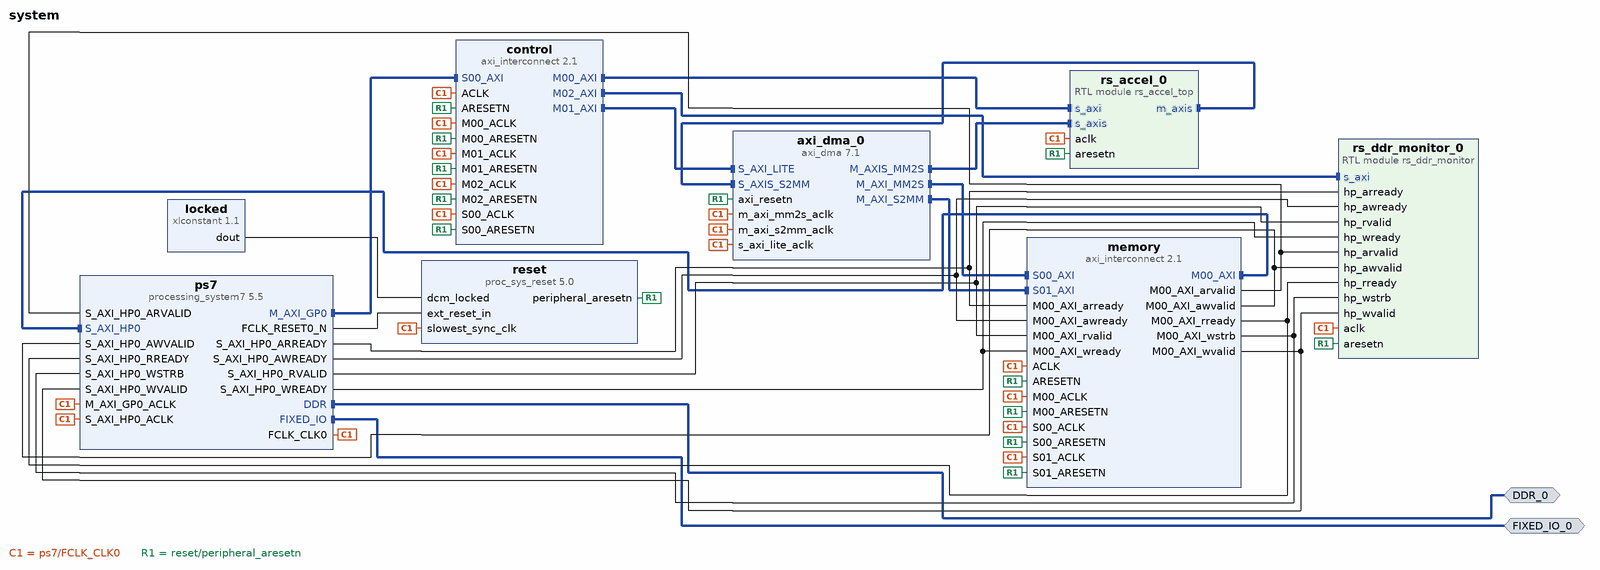
[diagram p0: block diagram of the top level]
# Vivado block design system, xc7z020clg400-1, Vivado 2025.2
create_bd_design system

create_bd_intf_port -mode Master -vlnv xilinx.com:interface:ddrx_rtl:1.0 DDR_0
create_bd_intf_port -mode Master -vlnv xilinx.com:display_processing_system7:fixedio_rtl:1.0 FIXED_IO_0

create_bd_cell -type ip -vlnv xilinx.com:ip:processing_system7:5.5 ps7
set_property -dict [list \
  CONFIG.PCW_APU_PERIPHERAL_FREQMHZ 650 \
  CONFIG.PCW_CRYSTAL_PERIPHERAL_FREQMHZ 50 \
  CONFIG.PCW_ENET0_ENET0_IO {MIO 16 .. 27} \
  CONFIG.PCW_ENET0_GRP_MDIO_ENABLE 1 \
  CONFIG.PCW_ENET0_GRP_MDIO_IO {MIO 52 .. 53} \
  CONFIG.PCW_ENET0_PERIPHERAL_ENABLE 1 \
  CONFIG.PCW_ENET0_RESET_ENABLE 1 \
  CONFIG.PCW_ENET0_RESET_IO {MIO 9} \
  CONFIG.PCW_ENET_RESET_ENABLE 1 \
  CONFIG.PCW_ENET_RESET_SELECT {Share reset pin} \
  CONFIG.PCW_EN_CLK1_PORT 1 \
  CONFIG.PCW_EN_CLK2_PORT 1 \
  CONFIG.PCW_EN_CLK3_PORT 1 \
  CONFIG.PCW_FPGA0_PERIPHERAL_FREQMHZ 100.0 \
  CONFIG.PCW_FPGA1_PERIPHERAL_FREQMHZ 142.86 \
  CONFIG.PCW_FPGA2_PERIPHERAL_FREQMHZ 200 \
  CONFIG.PCW_FPGA3_PERIPHERAL_FREQMHZ 166.67 \
  CONFIG.PCW_FPGA_FCLK1_ENABLE 1 \
  CONFIG.PCW_FPGA_FCLK2_ENABLE 1 \
  CONFIG.PCW_FPGA_FCLK3_ENABLE 1 \
  CONFIG.PCW_GPIO_MIO_GPIO_ENABLE 1 \
  CONFIG.PCW_GPIO_MIO_GPIO_IO MIO \
  CONFIG.PCW_I2C_RESET_ENABLE 1 \
  CONFIG.PCW_IRQ_F2P_INTR 1 \
  CONFIG.PCW_PERIPHERAL_BOARD_PRESET None \
  CONFIG.PCW_PRESET_BANK1_VOLTAGE {LVCMOS 1.8V} \
  CONFIG.PCW_QSPI_GRP_FBCLK_ENABLE 1 \
  CONFIG.PCW_QSPI_GRP_FBCLK_IO {MIO 8} \
  CONFIG.PCW_QSPI_GRP_SINGLE_SS_ENABLE 1 \
  CONFIG.PCW_QSPI_GRP_SINGLE_SS_IO {MIO 1 .. 6} \
  CONFIG.PCW_QSPI_PERIPHERAL_ENABLE 1 \
  CONFIG.PCW_QSPI_QSPI_IO {MIO 1 .. 6} \
  CONFIG.PCW_SD0_GRP_CD_ENABLE 1 \
  CONFIG.PCW_SD0_GRP_CD_IO {MIO 47} \
  CONFIG.PCW_SD0_GRP_WP_ENABLE 0 \
  CONFIG.PCW_SD0_PERIPHERAL_ENABLE 1 \
  CONFIG.PCW_SD0_SD0_IO {MIO 40 .. 45} \
  CONFIG.PCW_SDIO_PERIPHERAL_FREQMHZ 50 \
  CONFIG.PCW_SINGLE_QSPI_DATA_MODE x4 \
  CONFIG.PCW_UART0_PERIPHERAL_ENABLE 1 \
  CONFIG.PCW_UART0_UART0_IO {MIO 14 .. 15} \
  CONFIG.PCW_UART1_PERIPHERAL_ENABLE 0 \
  CONFIG.PCW_UART_PERIPHERAL_FREQMHZ 100 \
  CONFIG.PCW_UIPARAM_DDR_BUS_WIDTH {16 Bit} \
  CONFIG.PCW_UIPARAM_DDR_FREQ_MHZ 525 \
  CONFIG.PCW_UIPARAM_DDR_PARTNO {MT41J256M16 RE-125} \
  CONFIG.PCW_USB0_PERIPHERAL_ENABLE 1 \
  CONFIG.PCW_USB0_RESET_ENABLE 1 \
  CONFIG.PCW_USB0_RESET_IO {MIO 46} \
  CONFIG.PCW_USB0_USB0_IO {MIO 28 .. 39} \
  CONFIG.PCW_USB_RESET_ENABLE 1 \
  CONFIG.PCW_USB_RESET_SELECT {Share reset pin} \
  CONFIG.PCW_USE_FABRIC_INTERRUPT 1 \
  CONFIG.PCW_USE_S_AXI_HP0 1 \
  CONFIG.preset None \
] [get_bd_cells ps7]
# 506 more settings of ps7 are not shown: defaults, MIO pin electricals, DDR timing, and values the tool derives
create_bd_cell -type module -reference rs_accel_top rs_accel_0
set_property -dict {CONFIG.COLS 14 CONFIG.FILTERS 4 CONFIG.P_CONTEXTS 2 CONFIG.Q_CONTEXTS 2} [get_bd_cells rs_accel_0]
create_bd_cell -type module -reference rs_ddr_monitor rs_ddr_monitor_0
create_bd_cell -type ip -vlnv xilinx.com:ip:axi_dma:7.1 axi_dma_0
set_property -dict [list \
  CONFIG.c_include_mm2s_dre 0 \
  CONFIG.c_include_s2mm_dre 0 \
  CONFIG.c_include_sg 0 \
  CONFIG.c_m_axi_mm2s_data_width 64 \
  CONFIG.c_m_axi_s2mm_data_width 64 \
  CONFIG.c_m_axis_mm2s_tdata_width 32 \
  CONFIG.c_s_axis_s2mm_tdata_width 32 \
  CONFIG.c_sg_length_width 23 \
] [get_bd_cells axi_dma_0]
create_bd_cell -type ip -vlnv xilinx.com:ip:axi_interconnect:2.1 control
set_property -dict {CONFIG.NUM_MI 3} [get_bd_cells control]
create_bd_cell -type ip -vlnv xilinx.com:ip:axi_interconnect:2.1 memory
set_property -dict {CONFIG.NUM_MI 1 CONFIG.NUM_SI 2} [get_bd_cells memory]
create_bd_cell -type ip -vlnv xilinx.com:ip:proc_sys_reset:5.0 reset
create_bd_cell -type ip -vlnv xilinx.com:ip:xlconstant:1.1 locked
set_property -dict {CONFIG.CONST_VAL 1} [get_bd_cells locked]

# ---- connections ----

connect_bd_intf_net [get_bd_intf_pins axi_dma_0/M_AXIS_MM2S] [get_bd_intf_pins rs_accel_0/s_axis]
connect_bd_intf_net [get_bd_intf_pins axi_dma_0/M_AXI_MM2S] [get_bd_intf_pins memory/S00_AXI]
connect_bd_intf_net [get_bd_intf_pins axi_dma_0/M_AXI_S2MM] [get_bd_intf_pins memory/S01_AXI]
connect_bd_intf_net [get_bd_intf_pins control/M00_AXI] [get_bd_intf_pins rs_accel_0/s_axi]
connect_bd_intf_net [get_bd_intf_pins control/M01_AXI] [get_bd_intf_pins axi_dma_0/S_AXI_LITE]
connect_bd_intf_net [get_bd_intf_pins control/M02_AXI] [get_bd_intf_pins rs_ddr_monitor_0/s_axi]
connect_bd_intf_net [get_bd_intf_pins memory/M00_AXI] [get_bd_intf_pins ps7/S_AXI_HP0]
connect_bd_intf_net [get_bd_intf_ports DDR_0] [get_bd_intf_pins ps7/DDR]
connect_bd_intf_net [get_bd_intf_ports FIXED_IO_0] [get_bd_intf_pins ps7/FIXED_IO]
connect_bd_intf_net [get_bd_intf_pins ps7/M_AXI_GP0] [get_bd_intf_pins control/S00_AXI]
connect_bd_intf_net [get_bd_intf_pins rs_accel_0/m_axis] [get_bd_intf_pins axi_dma_0/S_AXIS_S2MM]
connect_bd_net -net M00_AXI_arready_1 [get_bd_pins ps7/S_AXI_HP0_ARREADY] \
  [get_bd_pins memory/M00_AXI_arready] [get_bd_pins rs_ddr_monitor_0/hp_arready]
connect_bd_net -net M00_AXI_awready_1 [get_bd_pins ps7/S_AXI_HP0_AWREADY] \
  [get_bd_pins memory/M00_AXI_awready] [get_bd_pins rs_ddr_monitor_0/hp_awready]
connect_bd_net -net M00_AXI_rvalid_1 [get_bd_pins ps7/S_AXI_HP0_RVALID] [get_bd_pins memory/M00_AXI_rvalid] [get_bd_pins rs_ddr_monitor_0/hp_rvalid]
connect_bd_net -net M00_AXI_wready_1 [get_bd_pins ps7/S_AXI_HP0_WREADY] [get_bd_pins memory/M00_AXI_wready] [get_bd_pins rs_ddr_monitor_0/hp_wready]
connect_bd_net [get_bd_pins locked/dout] [get_bd_pins reset/dcm_locked]
connect_bd_net [get_bd_pins memory/M00_AXI_arvalid] [get_bd_pins ps7/S_AXI_HP0_ARVALID] [get_bd_pins rs_ddr_monitor_0/hp_arvalid]
connect_bd_net [get_bd_pins memory/M00_AXI_awvalid] [get_bd_pins ps7/S_AXI_HP0_AWVALID] [get_bd_pins rs_ddr_monitor_0/hp_awvalid]
connect_bd_net [get_bd_pins memory/M00_AXI_rready] [get_bd_pins ps7/S_AXI_HP0_RREADY] [get_bd_pins rs_ddr_monitor_0/hp_rready]
connect_bd_net [get_bd_pins memory/M00_AXI_wstrb] [get_bd_pins ps7/S_AXI_HP0_WSTRB] [get_bd_pins rs_ddr_monitor_0/hp_wstrb]
connect_bd_net [get_bd_pins memory/M00_AXI_wvalid] [get_bd_pins ps7/S_AXI_HP0_WVALID] [get_bd_pins rs_ddr_monitor_0/hp_wvalid]
connect_bd_net [get_bd_pins ps7/FCLK_CLK0] \
  [get_bd_pins ps7/M_AXI_GP0_ACLK] [get_bd_pins ps7/S_AXI_HP0_ACLK] [get_bd_pins reset/slowest_sync_clk] \
  [get_bd_pins axi_dma_0/s_axi_lite_aclk] [get_bd_pins axi_dma_0/m_axi_mm2s_aclk] [get_bd_pins axi_dma_0/m_axi_s2mm_aclk] \
  [get_bd_pins control/ACLK] [get_bd_pins control/S00_ACLK] [get_bd_pins control/M00_ACLK] [get_bd_pins control/M01_ACLK] \
  [get_bd_pins control/M02_ACLK] [get_bd_pins memory/ACLK] [get_bd_pins memory/S00_ACLK] [get_bd_pins memory/S01_ACLK] \
  [get_bd_pins memory/M00_ACLK] [get_bd_pins rs_accel_0/aclk] [get_bd_pins rs_ddr_monitor_0/aclk]
connect_bd_net [get_bd_pins ps7/FCLK_RESET0_N] [get_bd_pins reset/ext_reset_in]
connect_bd_net [get_bd_pins reset/peripheral_aresetn] \
  [get_bd_pins axi_dma_0/axi_resetn] [get_bd_pins control/ARESETN] [get_bd_pins control/S00_ARESETN] \
  [get_bd_pins control/M00_ARESETN] [get_bd_pins control/M01_ARESETN] [get_bd_pins control/M02_ARESETN] \
  [get_bd_pins memory/ARESETN] [get_bd_pins memory/S00_ARESETN] [get_bd_pins memory/S01_ARESETN] \
  [get_bd_pins memory/M00_ARESETN] [get_bd_pins rs_accel_0/aresetn] [get_bd_pins rs_ddr_monitor_0/aresetn]

# ---- address map ----
assign_bd_address -offset 0x00000000 -range 512M -target_address_space [get_bd_addr_spaces axi_dma_0/Data_MM2S] [get_bd_addr_segs ps7/S_AXI_HP0/HP0_DDR_LOWOCM]
assign_bd_address -offset 0x00000000 -range 512M -target_address_space [get_bd_addr_spaces axi_dma_0/Data_S2MM] [get_bd_addr_segs ps7/S_AXI_HP0/HP0_DDR_LOWOCM]
assign_bd_address -offset 0x40000000 -range 4K -target_address_space [get_bd_addr_spaces ps7/Data] [get_bd_addr_segs rs_accel_0/s_axi/reg0]
assign_bd_address -offset 0x40001000 -range 4K -target_address_space [get_bd_addr_spaces ps7/Data] [get_bd_addr_segs rs_ddr_monitor_0/s_axi/reg0]
assign_bd_address -offset 0x40400000 -range 64K -target_address_space [get_bd_addr_spaces ps7/Data] [get_bd_addr_segs axi_dma_0/S_AXI_LITE/Reg]

validate_bd_design
save_bd_design
